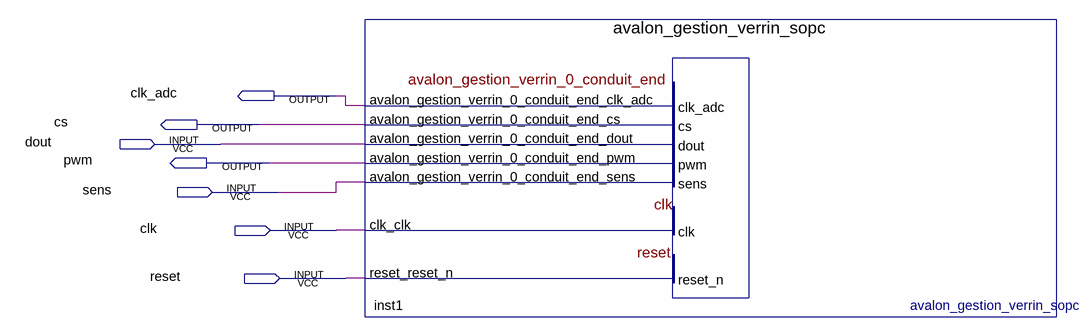
[diagram p0: schematic sheet]
// Quartus schematic avalon_gestion_verrin_block.bdf as structural Verilog: 1 symbols, 7 pins
module avalon_gestion_verrin_block (
  input  dout,
  input  sens,
  input  clk,
  input  reset,
  output clk_adc,
  output cs,
  output pwm
);

  avalon_gestion_verrin_sopc inst1 (
    .avalon_gestion_verrin_0_conduit_end_dout(dout), .avalon_gestion_verrin_0_conduit_end_sens(sens),
    .clk_clk(clk), .reset_reset_n(reset), .avalon_gestion_verrin_0_conduit_end_clk_adc(clk_adc),
    .avalon_gestion_verrin_0_conduit_end_cs(cs), .avalon_gestion_verrin_0_conduit_end_pwm(pwm));
endmodule
